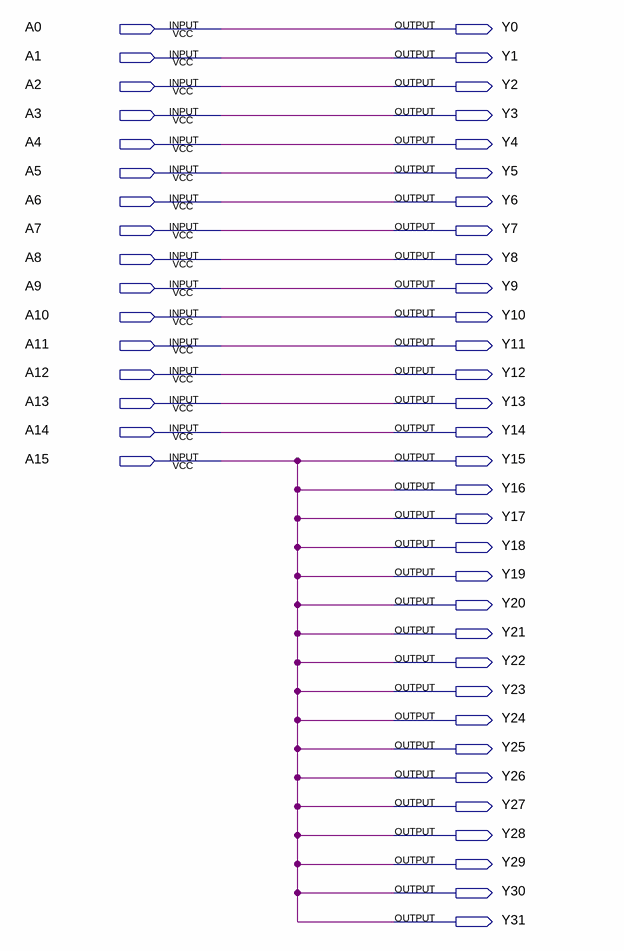
[diagram p0: schematic sheet]
// Quartus schematic Sign_Extend.bdf as structural Verilog: 0 symbols, 48 pins
module Sign_Extend (
  input  A0,
  input  A1,
  input  A2,
  input  A3,
  input  A4,
  input  A5,
  input  A6,
  input  A7,
  input  A8,
  input  A9,
  input  A10,
  input  A11,
  input  A12,
  input  A13,
  input  A14,
  input  A15,
  output Y0,
  output Y1,
  output Y2,
  output Y3,
  output Y4,
  output Y5,
  output Y6,
  output Y7,
  output Y8,
  output Y9,
  output Y10,
  output Y11,
  output Y12,
  output Y13,
  output Y14,
  output Y15,
  output Y16,
  output Y17,
  output Y18,
  output Y19,
  output Y20,
  output Y21,
  output Y22,
  output Y23,
  output Y24,
  output Y25,
  output Y26,
  output Y27,
  output Y28,
  output Y29,
  output Y30,
  output Y31
);


  assign Y0 = A0;
  assign Y1 = A1;
  assign Y2 = A2;
  assign Y3 = A3;
  assign Y4 = A4;
  assign Y5 = A5;
  assign Y6 = A6;
  assign Y7 = A7;
  assign Y8 = A8;
  assign Y9 = A9;
  assign Y10 = A10;
  assign Y11 = A11;
  assign Y12 = A12;
  assign Y13 = A13;
  assign Y14 = A14;
  assign Y15 = A15;
  assign Y16 = A15;
  assign Y17 = A15;
  assign Y18 = A15;
  assign Y19 = A15;
  assign Y20 = A15;
  assign Y21 = A15;
  assign Y22 = A15;
  assign Y23 = A15;
  assign Y24 = A15;
  assign Y25 = A15;
  assign Y26 = A15;
  assign Y27 = A15;
  assign Y28 = A15;
  assign Y29 = A15;
  assign Y30 = A15;
  assign Y31 = A15;
endmodule
